# EAGLE design PH_Amplifier_V_1.1.2 (EAGLE 9.6.2)
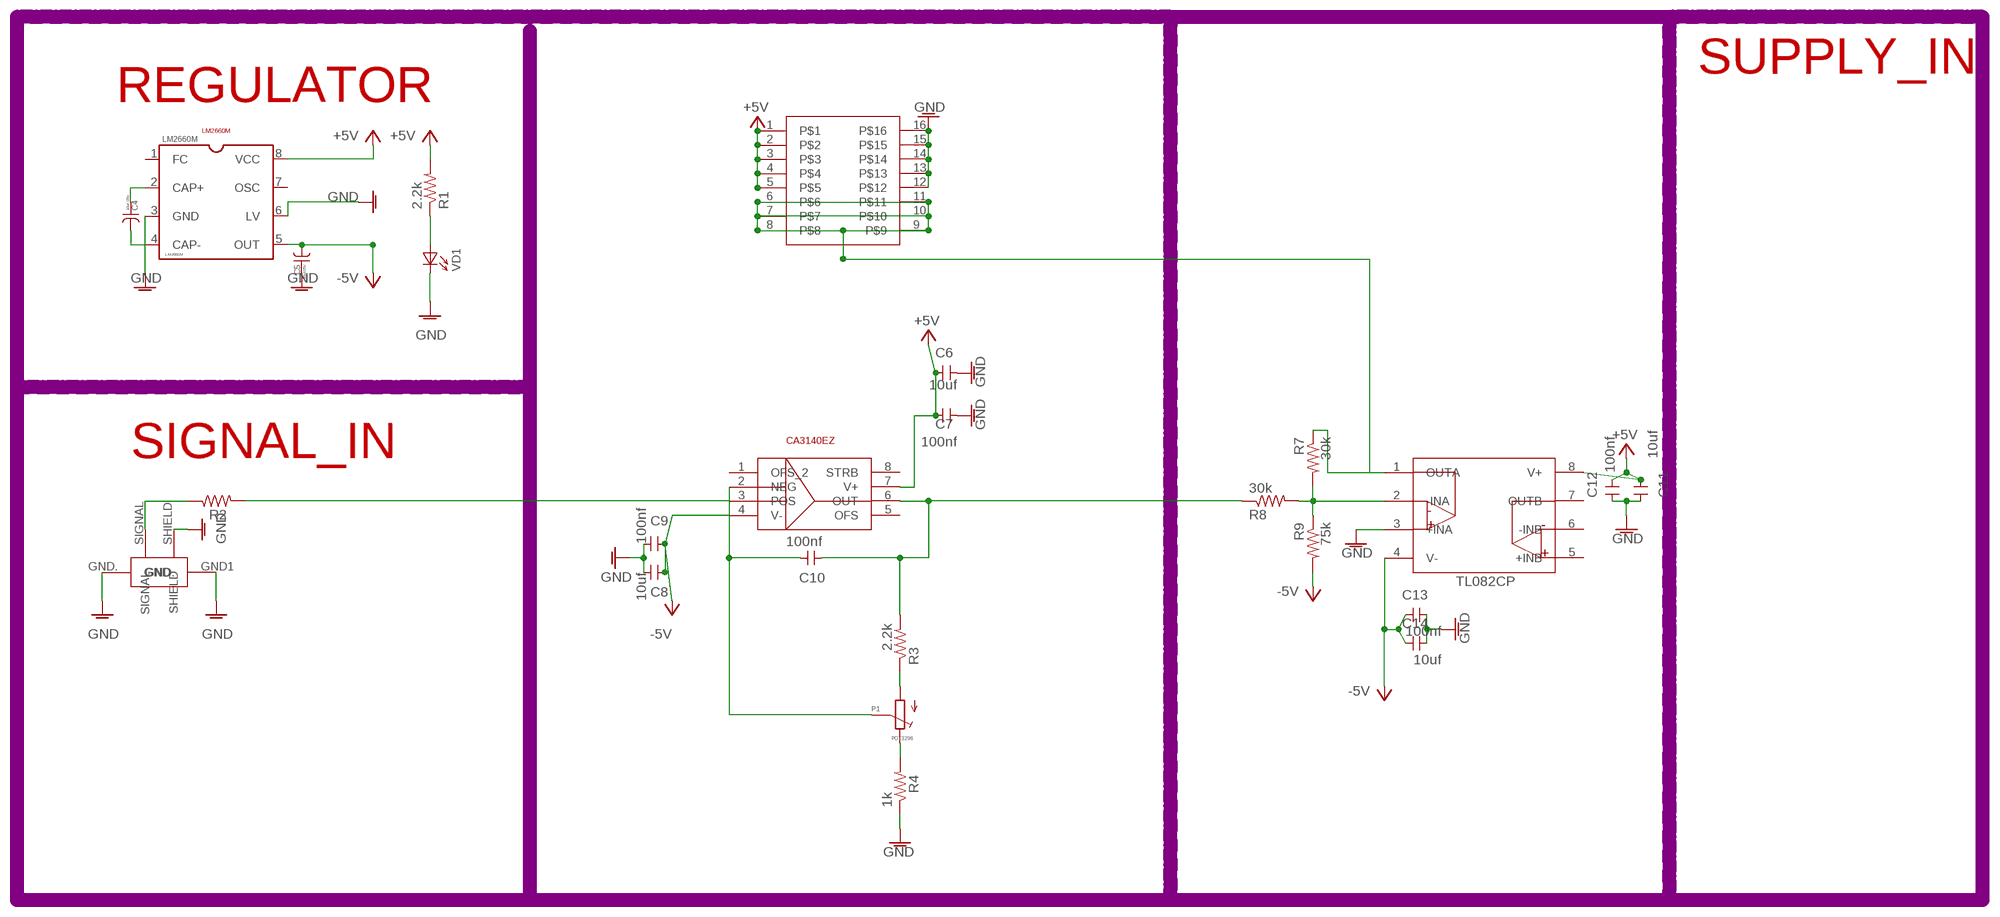
[diagram p0: schematic, sheet 1]

## Parts
C4  10uf /25v  CAP_TANTC  [TANT_2312]
C5  10uf/25v  CAP_TANTC  [TANT_2312]
C6  10uf  C-USC0805K  [C0805K]
C7  100nf  C-US025-024X044  [C025-024X044]
C8  10uf  C-US025-024X044  [C025-024X044]
C9  100nf  C-USC0805K  [C0805K]
C10  100nf  C-USC0805K  [C0805K]
C11  10uf  C-US025-024X044  [C025-024X044]
C12  100nf  C-USC0805K  [C0805K]
C13  100nf  C-USC0805K  [C0805K]
C14  10uf  C-US025-024X044  [C025-024X044]
CA3140EZ  CA3140EZ  [SOIC-08]
LM2660M  LM2660M  [SOIC-08]
P1  POT3296  [POT_3296]
R1  2.2k  R-US_M0805  [M0805]
R2  4.7M  R-US_M1206  [M1206]
R3  2.2k  R-US_M0805  [M0805]
R4  1k  R-US_M0805  [M0805]
R7  30k  R-US_M0805  [M0805]
R8  30k  R-US_M0805  [M0805]
R9  75k  R-US_M0805  [M0805]
TL082CP  TL08CP  [SOIC-08]
U$2  AMPLIFIER_BENCHTOP  [AMPLIFIER_BENCHTOP]
U$3  BNC_RIGHTANGLE  [BNC_RIGHTANGLE]
VD1  LED1206  [LED-1206]

## Nets
+5V: C6.1 C7.1 C11.1 C12.1 CA3140EZ.7(V+) LM2660M.8(VCC) R1.2 TL082CP.8(V+) U$2.1 U$2.2 U$2.3 U$2.4 U$2.5
-5V: C5.- C8.1 C9.1 C13.1 C14.1 CA3140EZ.4(V-) LM2660M.5(OUT) R9.2 TL082CP.4(V-)
GNDA: C5.+ C6.2 C7.2 C8.2 C9.2 C11.2 C12.2 C13.2 C14.2 LM2660M.3(GND) LM2660M.6(LV) R4.1 TL082CP.3(+INA) U$2.12 U$2.13 U$2.14 U$2.15 U$2.16 U$3.GND1(GND.) U$3.GND.(GND) U$3.SHIELD VD1.C ; supply symbol labelled GND
N$1: CA3140EZ.3(POS) R2.2
N$2: C4.+ LM2660M.2(CAP+)
N$3: C4.- LM2660M.4(CAP-)
N$4: R7.2 R8.2 R9.1 TL082CP.2(-INA)
N$5: C10.2 CA3140EZ.2(NEG) P1.S
N$6: P1.A R3.1
N$7: P1.E R4.2
N$8: R1.1 VD1.A
N$9: C10.1 CA3140EZ.6(OUT) R3.2 R8.1
N$10: R2.1 U$3.SIGNAL
N$12: R7.1 TL082CP.1(OUTA) U$2.6 U$2.7 U$2.8 U$2.9 U$2.10 U$2.11
Unconnected: CA3140EZ.1(OFS_2) CA3140EZ.5(OFS) CA3140EZ.8(STRB) LM2660M.1(FC) LM2660M.7(OSC) TL082CP.5(+INB) TL082CP.6(-INB) TL082CP.7(OUTB)

## Notes on the sheet
- SUPPLY_IN
- REGULATOR
- SIGNAL_IN

## Library data of the parts
C4 C5 = Squadron:CAP_TANT
C6-C14 = rcl:C-US: CAPACITOR, American symbol; SPICEPREFIX: C
CA3140EZ = Squadron:CA3140EZ
LM2660M = Squadron:LM2660M
P1 = Squadron:POT
R1-R4 R7-R9 = rcl:R-US_: RESISTOR, American symbol; SPICEPREFIX: R
TL082CP = Squadron:TL08CP
U$2 = Squadron:AMPLIFIER_BENCHTOP
U$3 = Squadron:BNC_RIGHTANGLE
VD1 = led:LED: LEDs SMD Leds

## Board
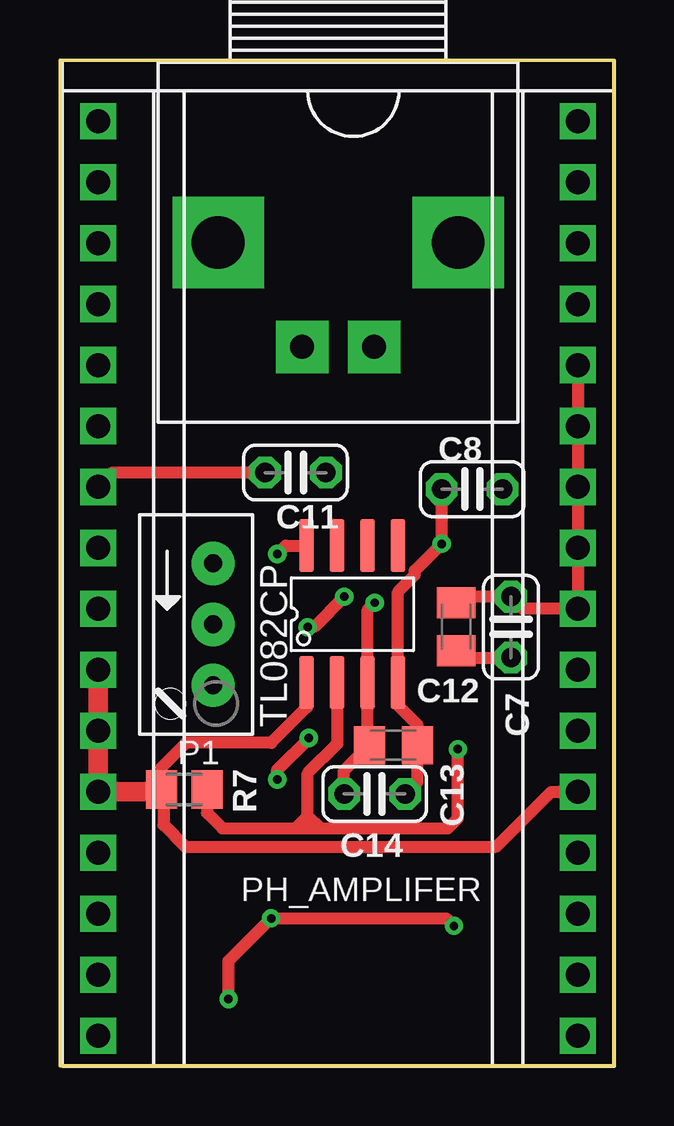
[diagram p1: board, top side]
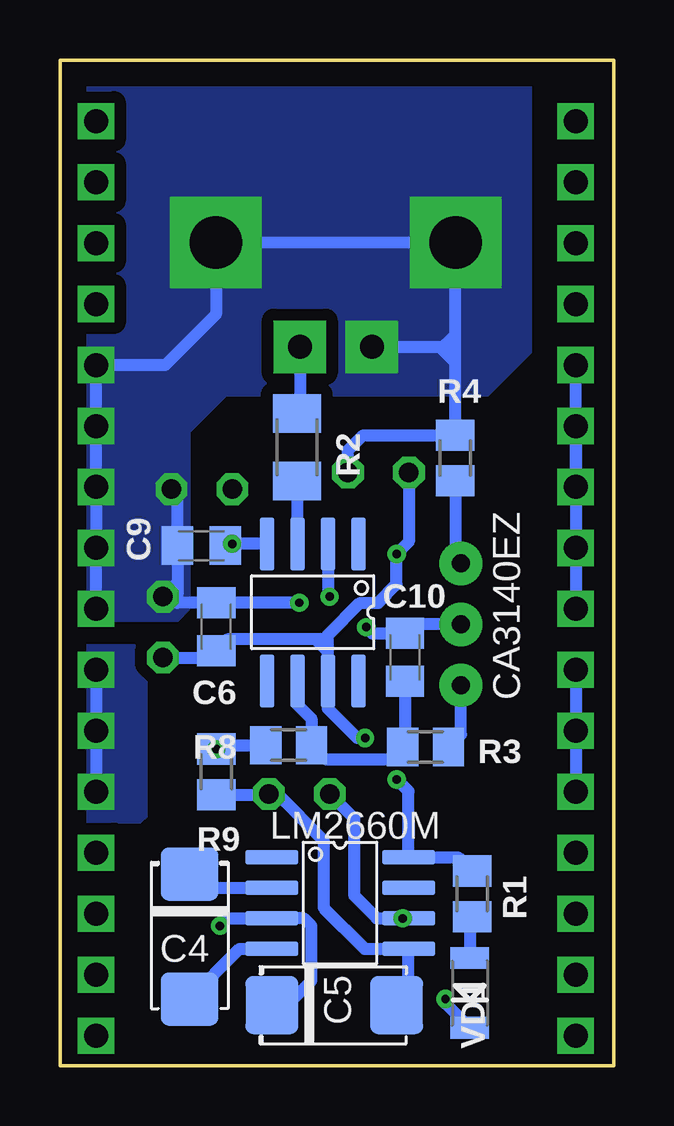
[diagram p2: board, bottom side, seen from below]

Size 23.1 x 41.9 mm. Coordinates in mm from the lower left corner, seen from the top.
Copper layers (1*16): Top 0.035mm / dielectric 1.5mm / Bottom 0.035mm
Design rules "default": minimum track width 6mil, minimum drill 0.35mm, track to track 6mil, track to pad 6mil, pad to pad 6mil, via to via 6mil, smd to smd 6mil, copper to edge 40mil, drill to drill 6mil, minimum pad ring 10mil, minimum via ring 8mil, stop-mask expansion 4mil, vias tented up to drill 0mil, thermal gap 10mil

### Footprints (pad centres in the part's own frame; a part is rotated, then mirrored left to right if it is on the bottom)
TANT_2312 = smd 2.2 x 2.4: + -2.6,0; - 2.6,0
C0805K = smd 1.3 x 1.6: 1 -1,0; 2 1,0
C025-024X044 = drill 0.813 octagon: 1 -1.27,0; 2 1.27,0
SOIC-08 = smd 0.6 x 2.2: 1 -1.905,-2.854; 2 -0.635,-2.854; 3 0.635,-2.854; 4 1.905,-2.854; 5 1.905,2.854; 6 0.635,2.854; 7 -0.635,2.854; 8 -1.905,2.854
POT_3296 = drill 0.75 pad 1.8: A 2.54,0; E -2.54,0; S 0,0
M0805 = smd 1.3 x 1.6: 1 -0.95,0; 2 0.95,0
M1206 = smd 1.6 x 2: 1 -1.4,0; 2 1.4,0
AMPLIFIER_BENCHTOP = drill 1 square: 1 -10,8.89; 2 -10,6.35; 3 -10,3.81; 4 -10,1.27; 5 -10,-1.27; 6 -10,-3.81; 7 -10,-6.35; 8 -10,-8.89; 9 10,-8.89; 10 10,-6.35; 11 10,-3.81; 12 10,-1.27; 13 10,1.27; 14 10,3.81; 15 10,6.35; 16 10,8.89; 17 -10,11.43; 18 -10,13.97; 19 -10,16.51; 20 -10,19.05; 21 10,11.43; 22 10,13.97; 23 10,16.51; 24 10,19.05; 25 10,-11.43; 26 10,-13.97; 27 10,-16.51; 28 10,-19.05; 29 -10,-11.43; 30 -10,-13.97; 31 -10,-16.51; 32 -10,-19.05
BNC_RIGHTANGLE = drill 2.2 pad 3.81 square: GND1 -5,0; GND. 5,0 | drill 1 pad 2.184 square: SHIELD 1.5,4.35; SIGNAL -1.5,4.35
LED-1206 = smd 0.9 x 1.6: A -1.45,0; C 1.45,0

### Placement (x,y rotation side)
C4  17.7,5.37 270 bottom
C5  11.66,2.52 0 bottom
C6  16.59,18.28 90 bottom
C7  18.81,18.27 90 top
C8  17.19,24.02 0 top
C9  17.2,21.66 180 bottom
C10  8.71,17.01 90 bottom
C11  9.82,24.71 0 top
C12  16.52,18.28 90 top
C13  13.9,13.35 180 top
C14  13.12,11.32 180 top
CA3140EZ  12.56,18.89 180 bottom
LM2660M  11.42,6.77 270 bottom
P1  6.38,18.38 270 top
R1  5.92,7.16 90 bottom
R2  13.22,25.76 270 bottom
R3  7.86,13.28 180 bottom
R4  6.61,25.31 270 bottom
R7  5.18,11.5 0 top
R8  13.57,13.35 180 bottom
R9  16.59,12.24 270 bottom
TL082CP  12.19,18.81 0 top
U$2  11.6,20.3 0 top
U$3  11.6,34.3 180 top
VD1  6.01,3.03 270 bottom

### Tracks (layer width: path | path; a pad name or v marks a point on that pad's centre or on a via)
+5V  (via drill 0.35)
  Top 0.508: v9.06,21.32 9.41,21.66 TL082CP.8 | C11.1 2.2,24.71 U$2.3 | v9.06,11.92 9.06,12.33 v10.38,13.65 | C12.1 16.8,17 C7.1
  Bottom 0.508: 11.93,17.25 CA3140EZ.7 11.93,14.87 10.7,13.65 v10.38,13.65 | 11.93,17.25 11.93,17.76 | 11.93,17.76 11.93,17.94 | 11.93,17.94 10.58,19.28 9.82,19.28 9.06,20.05 v9.06,21.32 8.55,21.82 C11.1 | C7.1 16.87,17 C6.1 16.11,17.76 12.43,17.76 | U$2.3 U$2.2 | U$2.2 U$2.4 U$2.5 | U$2.2 U$2.1 | 11.93,17.76 12.11,17.76 | 11.93,17.94 12.11,17.76 | 12.11,17.76 12.43,17.76 | 11.93,17.25 12.43,17.76 | R1.2 6.49,8.68 LM2660M.8 8.57,11.43 v9.06,11.92
-5V  (via drill 0.35)
  Top 0.508: C8.1 v15.92,21.74 14.8,20.62 14.8,20.45 14.1,19.74 TL082CP.4 14.1,15.01 14.9,14.2 C13.1 14.9,11.83 C14.1
  Bottom 0.508: CA3140EZ.4 v15.92,21.74 16.13,21.74 C9.1 | R9.2 14.42,11.29 C14.1 14.05,11.32 12.11,9.38 12.11,6.58 10.39,4.87 LM2660M.5 8.57,3.01 C5.-
GNDA  (via drill 0.35)
  Top 0.508: C14.2 11.85,12.3 C13.2 12.83,13.35 TL082CP.3 12.83,18.99 v13.12,19.28 | v16.43,5.82 16.11,6.14 v8.81,6.14 7.03,4.36 v7.03,2.77 | U$2.16 U$2.12 19.31,19.03 C7.2 16.77,19.54 C12.2
  Bottom 0.508: C8.2 18.2,23.76 C9.2 18.2,20.14 | 18.63,19.71 18.2,20.14 | C6.2 18.55,19.28 | 18.55,19.28 C7.2 18.63,19.71 | C6.2 18.2,19.28 18.63,19.71 | 18.2,20.14 18.2,19.63 18.55,19.28 | C11.2 11.09,25.63 10.46,26.26 R4.1 6.61,29.28 | 6.61,29.28 6.61,29.95 | 6.61,29.95 6.61,30.46 | 6.61,30.46 6.61,34.29 | 6.61,34.29 U$3.GND. | U$3.SHIELD 7.28,29.95 | 7.28,29.95 7.03,29.95 | 6.61,29.95 7.03,29.95 | 6.61,30.46 7.03,30.05 7.03,29.95 | 7.28,29.95 6.61,29.28 | 6.61,34.29 6.63,34.3 U$3.GND1 16.6,31.3 18.71,29.19 21.51,29.19 | 21.51,29.19 U$2.16 | U$2.12 U$2.13 U$2.14 U$2.15 21.6,29.1 21.51,29.19 | v13.12,19.28 C6.2 | C5.+ 13.63,2.52 12.62,3.54 12.62,5.82 12.93,6.14 LM2660M.3 16.11,6.14 v16.43,5.82 | C14.2 10.84,10.3 10.84,7.09 9.88,6.14 v8.81,6.14 LM2660M.6 | VD1.C 7.03,2.59 v7.03,2.77
  pour Bottom (isolate 0.5, no thermals): 3.47,29.7 5.25,27.92 16.17,27.92 17.7,26.4 17.7,19.03 18.2,18.52 22.78,18.52 22.78,41.38 22.52,41.64 3.73,41.64 3.47,41.38
N$1
  Bottom 0.508: R2.2 13.22,21.76 CA3140EZ.3
N$2
  Bottom 0.508: C4.+ 17.13,7.41 LM2660M.2
N$3
  Bottom 0.508: C4.- 15.6,4.87 LM2660M.4
N$4  (via drill 0.35)
  Top 0.508: 10.84,9.89 16.17,9.89 16.59,10.3 R9.1 | TL082CP.2 11.56,13.4 10.33,12.17 10.33,10.39 | 10.84,9.89 10.33,10.39 | R7.2 6.13,10.53 6.77,9.89 9.82,9.89 | 9.82,9.89 10.84,9.89 | 9.82,9.89 10.33,10.39
  Bottom 0.508: R9.1 16.43,13.35 R8.2
  other vias: 16.59,13.19
N$5  (via drill 0.35)
  Top 0.508: v11.85,19.54 10.58,18.27 v10.33,18.27
  Bottom 0.508: P1.S 8.34,18.38 C10.2 10.08,18.01 v10.33,18.27 | CA3140EZ.2 11.93,19.61 v11.85,19.54
N$6
  Bottom 0.508: R3.1 6.38,13.81 P1.A
N$7
  Bottom 0.508: R4.2 6.61,21.16 P1.E
N$8
  Bottom 0.508: R1.1 6.01,6.12 VD1.A
N$9
  Bottom 0.508: C10.1 8.71,13.37 R3.2 9.31,12.77 12.04,12.77 R8.1 12.62,14.46 13.2,15.04 CA3140EZ.6
N$10
  Bottom 0.508: U$3.SIGNAL 13.1,27.28 R2.1
N$12
  Top 0.508: TL082CP.1 10.29,14.92 8.81,13.44 5.25,13.44 4.23,12.43 R7.1 4.32,11.42 4.32,10.03 5.22,9.12 18.2,9.12 20.49,11.41 U$2.9
  Top 0.813: U$2.6 U$2.8 4.23,11.41 R7.1
  Bottom 0.508: U$2.6 U$2.7 U$2.8 | U$2.11 U$2.10 U$2.9
  pour Bottom (isolate 0.5, no thermals): 19.98,17.51 22.52,17.51 22.78,17.25 22.78,10.39 22.52,10.14 19.73,10.14 19.47,10.39 19.47,17

### Text on the board
tNames: PH_AMPLIFER